# Altium schematic sheet DIOT_connectors_P1_P2_P3.SchDoc: =DocumentName
size A3; EDA_Number: EDA-04514-V3-0; Projet: DI/OT System Board; ModifiedBy: -; CheckedDate: -; Title2: DIOT connectors P1 P2 P3; DivGrp: WUT ISE; Designer: F.Świtakowski; DocumentNumber: 2; Revision: 0; SheetNumber: 2; SheetTotal: 17
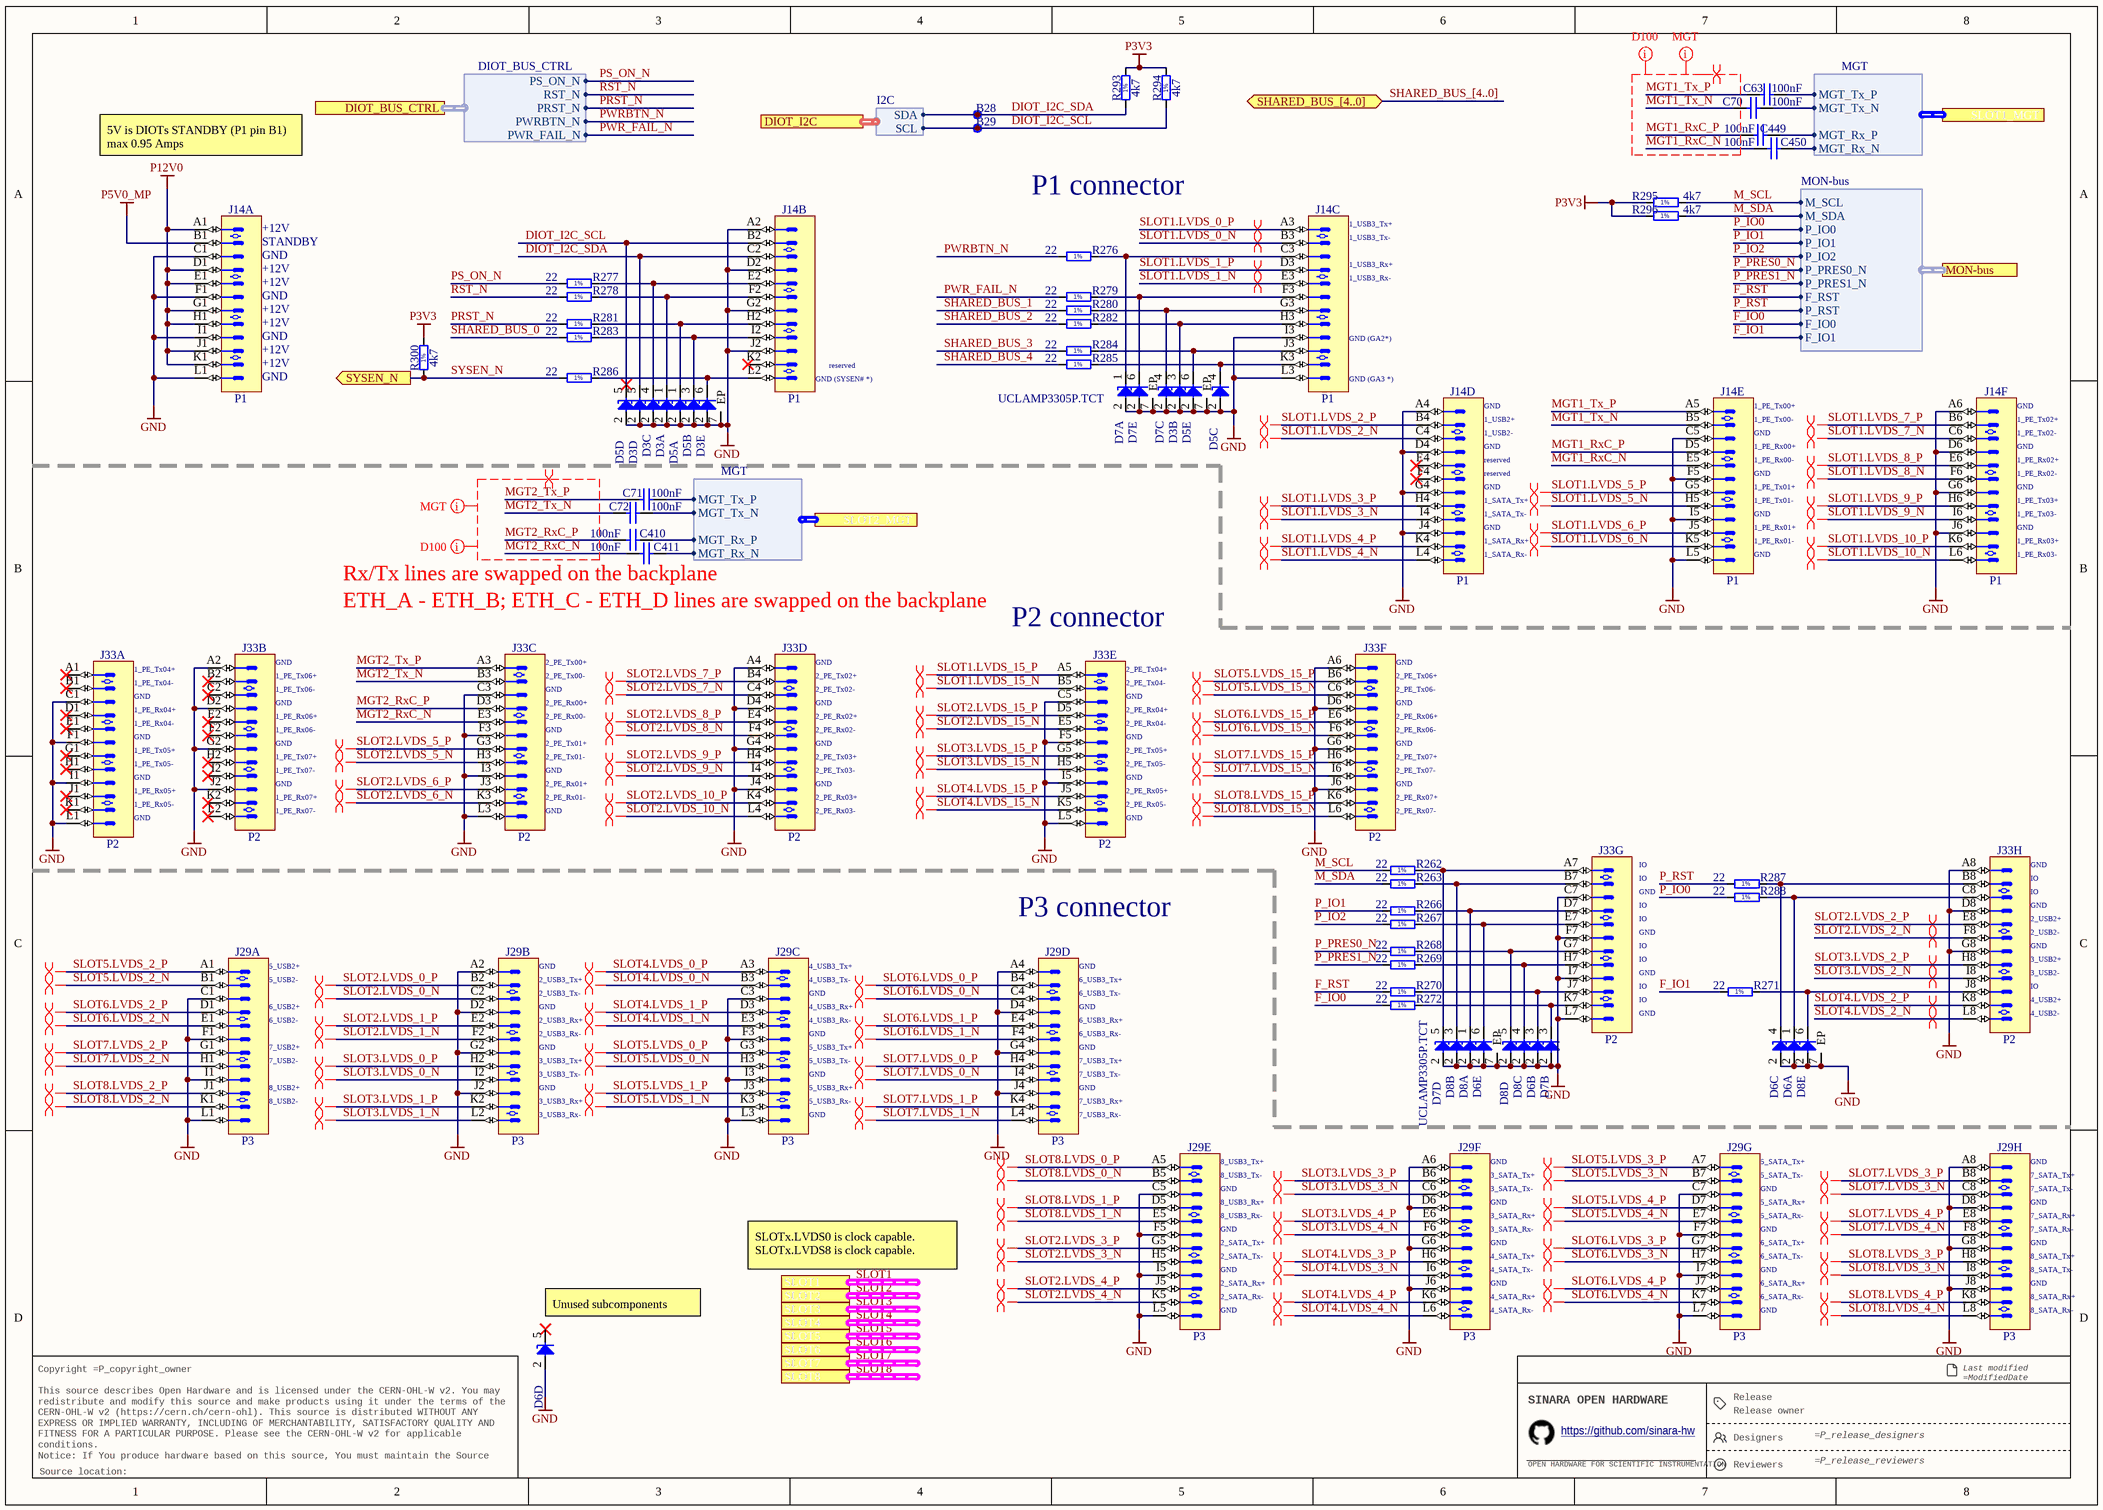
[diagram p0: DIOT_connectors_P1_P2_P3.SchDoc]

## Parts
B28  SMD Pad  [C100]  (value not drawn)  (no BOM)
B29  SMD Pad  [C100]  (value not drawn)  (no BOM)
C63  100nF  [CAPC0603X33N]
C70  100nF  [CAPC0603X33N]
C71  100nF  [CAPC0603X33N]
C72  100nF  [CAPC0603X33N]
C410  100nF  [CAPC0603X33N]
C411  100nF  [CAPC0603X33N]
C449  100nF  [CAPC0603X33N]
C450  100nF  [CAPC0603X33N]
D3  UCLAMP3305P.TCT  [SON50P160X65_HS-7N]  (value not drawn)  (parts A,B,C,D,E of 5)
D5  UCLAMP3305P.TCT  [SON50P160X65_HS-7N]  (value not drawn)  (parts A,B,C,D,E of 5)
D6  UCLAMP3305P.TCT  [SON50P160X65_HS-7N]  (value not drawn)  (parts A,B,C,D,E of 5)
D7  UCLAMP3305P.TCT  [SON50P160X65_HS-7N]  (value not drawn)  (parts A,B,C,D,E of 5)
D8  UCLAMP3305P.TCT  [SON50P160X65_HS-7N]  (value not drawn)  (parts A,B,C,D,E of 5)
J14  P1  [AMPHENOL_10052825-101LF]  (parts A,B,C,D,E,F of 6)
J29  P3  [AMPHENOL_10052837-101LF]  (parts A,B,C,D,E,F,G,H of 8)
J33  P2  [AMPHENOL_10052837-101LF]  (parts A,B,C,D,E,F,G,H of 8)
R262  22  [RESC1005X40N]
R263  22  [RESC1005X40N]
R266  22  [RESC1005X40N]
R267  22  [RESC1005X40N]
R268  22  [RESC1005X40N]
R269  22  [RESC1005X40N]
R270  22  [RESC1005X40N]
R271  22  [RESC1005X40N]
R272  22  [RESC1005X40N]
R276  22  [RESC1005X40N]
R277  22  [RESC1005X40N]
R278  22  [RESC1005X40N]
R279  22  [RESC1005X40N]
R280  22  [RESC1005X40N]
R281  22  [RESC1005X40N]
R282  22  [RESC1005X40N]
R283  22  [RESC1005X40N]
R284  22  [RESC1005X40N]
R285  22  [RESC1005X40N]
R286  22  [RESC1005X40N]
R287  22  [RESC1005X40N]
R288  22  [RESC1005X40N]
R293  4k7  [RESC1005X40N]
R294  4k7  [RESC1005X40N]
R295  4k7  [RESC1005X40N]
R296  4k7  [RESC1005X40N]
R300  4k7  [RESC1005X40N]

## Ports
DIOT_BUS_CTRL (harness DIOT_BUS_CTRL), DIOT_I2C (harness I2C), MON-bus (harness MON-bus), SHARED_BUS_[4..0] (bidir), SLOT1 (harness SLOT), SLOT1_MGT (harness MGT), SLOT2 (harness SLOT), SLOT2_MGT (harness MGT), SLOT3 (harness SLOT), SLOT4 (harness SLOT), SLOT5 (harness SLOT), SLOT6 (harness SLOT), SLOT7 (harness SLOT), SLOT8 (harness SLOT), SYSEN_N (out)

## Harnesses
MGT: MGT_Tx_P, MGT_Tx_N, MGT_Rx_P, MGT_Rx_N
DIOT_BUS_CTRL: PS_ON_N, RST_N, PRST_N, PWRBTN_N, PWR_FAIL_N
MON-bus: M_SCL, M_SDA, P_IO0, P_IO1, P_IO2, P_PRES0_N, P_PRES1_N, F_RST, P_RST, F_IO0, F_IO1
I2C: SDA, SCL

## Nets
GND: D3.2(A) D3.7(EP) D5.2(A) D5.7(EP) D6.2(A) D6.7(EP) D7.2(A) D7.7(EP) D8.2(A) D8.7(EP) J14.A2 J14.A4 J14.A6 J14.C1 J14.C5 J14.D2 J14.D4 J14.D6 J14.F1 J14.F5 J14.G2 J14.G4 J14.G6 J14.I1 J14.I3 J14.I5 J14.J2 J14.J4 J14.J6 J14.L1 J14.L3 J14.L5 J29.A2 J29.A4 J29.A6 J29.A8 J29.C1 J29.C3 J29.C5 J29.C7 J29.D2 J29.D4 J29.D6 J29.D8 J29.F1 J29.F3 J29.F5 J29.F7 J29.G2 J29.G4 J29.G6 J29.G8 J29.I1 J29.I3 J29.I5 J29.I7 J29.J2 J29.J4 J29.J6 J29.J8 J29.L1 J29.L3 J29.L5 J29.L7 J33.A2 J33.A4 J33.A6 J33.A8 J33.C1 J33.C3 J33.C5 J33.C7 J33.D2 J33.D4 J33.D6 J33.D8 J33.F1 J33.F3 J33.F5 J33.F7 J33.G2 J33.G4 J33.G6 J33.G8 J33.I1 J33.I3 J33.I5 J33.I7 J33.J2 J33.J4 J33.J6 J33.L1 J33.L3 J33.L5 J33.L7
P3V3: R293.2 R294.2 R295.2 R296.2 R300.2
P5V0_MP: J14.B1
P12V0: J14.A1 J14.D1 J14.E1 J14.G1 J14.H1 J14.J1 J14.K1
DIOT_I2C_SCL: B29.1 D5.5(C) J14.B2 R294.1 ; port DIOT_I2C.SCL
DIOT_I2C_SDA: B28.1 D3.5(C) J14.C2 R293.1 ; port DIOT_I2C.SDA
F_IO0: R272.1 ; port MON-bus.F_IO0
F_IO1: R271.1 ; port MON-bus.F_IO1
F_RST: R270.1 ; port MON-bus.F_RST
M_SCL: R262.1 R295.1 ; port MON-bus.M_SCL
M_SDA: R263.1 R296.1 ; port MON-bus.M_SDA
MGT1_RxC_N: C450.1 J14.E5
MGT1_RxC_P: C449.1 J14.D5
MGT1_Tx_N: C70.2 J14.B5
MGT1_Tx_P: C63.2 J14.A5
MGT2_RxC_N: C411.1 J33.E3
MGT2_RxC_P: C410.1 J33.D3
MGT2_Tx_N: C72.2 J33.B3
MGT2_Tx_P: C71.2 J33.A3
P_IO0: R288.1 ; port MON-bus.P_IO0
P_IO1: R266.1 ; port MON-bus.P_IO1
P_IO2: R267.1 ; port MON-bus.P_IO2
P_PRES0_N: R268.1 ; port MON-bus.P_PRES0_N
P_PRES1_N: R269.1 ; port MON-bus.P_PRES1_N
P_RST: R287.1 ; port MON-bus.P_RST
PRST_N: R281.1 ; port DIOT_BUS_CTRL.PRST_N
PS_ON_N: R277.1 ; port DIOT_BUS_CTRL.PS_ON_N
PWR_FAIL_N: R279.1 ; port DIOT_BUS_CTRL.PWR_FAIL_N
PWRBTN_N: R276.1 ; port DIOT_BUS_CTRL.PWRBTN_N
RST_N: R278.1 ; port DIOT_BUS_CTRL.RST_N
SHARED_BUS_0: R283.1
SHARED_BUS_1: R280.1
SHARED_BUS_2: R282.1
SHARED_BUS_3: R284.1
SHARED_BUS_4: R285.1
SLOT1.LVDS_0_N: J14.B3
SLOT1.LVDS_0_P: J14.A3
SLOT1.LVDS_1_N: J14.E3
SLOT1.LVDS_1_P: J14.D3
SLOT1.LVDS_2_N: J14.C4
SLOT1.LVDS_2_P: J14.B4
SLOT1.LVDS_3_N: J14.I4
SLOT1.LVDS_3_P: J14.H4
SLOT1.LVDS_4_N: J14.L4
SLOT1.LVDS_4_P: J14.K4
SLOT1.LVDS_5_N: J14.H5
SLOT1.LVDS_5_P: J14.G5
SLOT1.LVDS_6_N: J14.K5
SLOT1.LVDS_6_P: J14.J5
SLOT1.LVDS_7_N: J14.C6
SLOT1.LVDS_7_P: J14.B6
SLOT1.LVDS_8_N: J14.F6
SLOT1.LVDS_8_P: J14.E6
SLOT1.LVDS_9_N: J14.I6
SLOT1.LVDS_9_P: J14.H6
SLOT1.LVDS_10_N: J14.L6
SLOT1.LVDS_10_P: J14.K6
SLOT1.LVDS_15_N: J33.B5
SLOT1.LVDS_15_P: J33.A5
SLOT2.LVDS_0_N: J29.C2
SLOT2.LVDS_0_P: J29.B2
SLOT2.LVDS_1_N: J29.F2
SLOT2.LVDS_1_P: J29.E2
SLOT2.LVDS_2_N: J33.F8
SLOT2.LVDS_2_P: J33.E8
SLOT2.LVDS_3_N: J29.H5
SLOT2.LVDS_3_P: J29.G5
SLOT2.LVDS_4_N: J29.K5
SLOT2.LVDS_4_P: J29.J5
SLOT2.LVDS_5_N: J33.H3
SLOT2.LVDS_5_P: J33.G3
SLOT2.LVDS_6_N: J33.K3
SLOT2.LVDS_6_P: J33.J3
SLOT2.LVDS_7_N: J33.C4
SLOT2.LVDS_7_P: J33.B4
SLOT2.LVDS_8_N: J33.F4
SLOT2.LVDS_8_P: J33.E4
SLOT2.LVDS_9_N: J33.I4
SLOT2.LVDS_9_P: J33.H4
SLOT2.LVDS_10_N: J33.L4
SLOT2.LVDS_10_P: J33.K4
SLOT2.LVDS_15_N: J33.E5
SLOT2.LVDS_15_P: J33.D5
SLOT3.LVDS_0_N: J29.I2
SLOT3.LVDS_0_P: J29.H2
SLOT3.LVDS_1_N: J29.L2
SLOT3.LVDS_1_P: J29.K2
SLOT3.LVDS_2_N: J33.I8
SLOT3.LVDS_2_P: J33.H8
SLOT3.LVDS_3_N: J29.C6
SLOT3.LVDS_3_P: J29.B6
SLOT3.LVDS_4_N: J29.F6
SLOT3.LVDS_4_P: J29.E6
SLOT3.LVDS_15_N: J33.H5
SLOT3.LVDS_15_P: J33.G5
SLOT4.LVDS_0_N: J29.B3
SLOT4.LVDS_0_P: J29.A3
SLOT4.LVDS_1_N: J29.E3
SLOT4.LVDS_1_P: J29.D3
SLOT4.LVDS_2_N: J33.L8
SLOT4.LVDS_2_P: J33.K8
SLOT4.LVDS_3_N: J29.I6
SLOT4.LVDS_3_P: J29.H6
SLOT4.LVDS_4_N: J29.L6
SLOT4.LVDS_4_P: J29.K6
SLOT4.LVDS_15_N: J33.K5
SLOT4.LVDS_15_P: J33.J5
SLOT5.LVDS_0_N: J29.H3
SLOT5.LVDS_0_P: J29.G3
SLOT5.LVDS_1_N: J29.K3
SLOT5.LVDS_1_P: J29.J3
SLOT5.LVDS_2_N: J29.B1
SLOT5.LVDS_2_P: J29.A1
SLOT5.LVDS_3_N: J29.B7
SLOT5.LVDS_3_P: J29.A7
SLOT5.LVDS_4_N: J29.E7
SLOT5.LVDS_4_P: J29.D7
SLOT5.LVDS_15_N: J33.C6
SLOT5.LVDS_15_P: J33.B6
SLOT6.LVDS_0_N: J29.C4
SLOT6.LVDS_0_P: J29.B4
SLOT6.LVDS_1_N: J29.F4
SLOT6.LVDS_1_P: J29.E4
SLOT6.LVDS_2_N: J29.E1
SLOT6.LVDS_2_P: J29.D1
SLOT6.LVDS_3_N: J29.H7
SLOT6.LVDS_3_P: J29.G7
SLOT6.LVDS_4_N: J29.K7
SLOT6.LVDS_4_P: J29.J7
SLOT6.LVDS_15_N: J33.F6
SLOT6.LVDS_15_P: J33.E6
SLOT7.LVDS_0_N: J29.I4
SLOT7.LVDS_0_P: J29.H4
SLOT7.LVDS_1_N: J29.L4
SLOT7.LVDS_1_P: J29.K4
SLOT7.LVDS_2_N: J29.H1
SLOT7.LVDS_2_P: J29.G1
SLOT7.LVDS_3_N: J29.C8
SLOT7.LVDS_3_P: J29.B8
SLOT7.LVDS_4_N: J29.F8
SLOT7.LVDS_4_P: J29.E8
SLOT7.LVDS_15_N: J33.I6
SLOT7.LVDS_15_P: J33.H6
SLOT8.LVDS_0_N: J29.B5
SLOT8.LVDS_0_P: J29.A5
SLOT8.LVDS_1_N: J29.E5
SLOT8.LVDS_1_P: J29.D5
SLOT8.LVDS_2_N: J29.K1
SLOT8.LVDS_2_P: J29.J1
SLOT8.LVDS_3_N: J29.I8
SLOT8.LVDS_3_P: J29.H8
SLOT8.LVDS_4_N: J29.L8
SLOT8.LVDS_4_P: J29.K8
SLOT8.LVDS_15_N: J33.L6
SLOT8.LVDS_15_P: J33.K6
SYSEN_N: R286.1 R300.1 ; port SYSEN_N
NetC63_1: C63.1 ; port SLOT1_MGT.MGT_Tx_P
NetC70_1: C70.1 ; port SLOT1_MGT.MGT_Tx_N
NetC71_1: C71.1 ; port SLOT2_MGT.MGT_Tx_P
NetC72_1: C72.1 ; port SLOT2_MGT.MGT_Tx_N
NetC410_2: C410.2 ; port SLOT2_MGT.MGT_Rx_P
NetC411_2: C411.2 ; port SLOT2_MGT.MGT_Rx_N
NetC449_2: C449.2 ; port SLOT1_MGT.MGT_Rx_P
NetC450_2: C450.2 ; port SLOT1_MGT.MGT_Rx_N
NetD3_1: D3.1(C) J14.F2 R278.2
NetD3_3: D3.3(C) J14.H3 R282.2
NetD3_4: D3.4(C) J14.E2 R277.2
NetD3_6: D3.6(C) J14.L2 R286.2
NetD5_1: D5.1(C) J14.H2 R281.2
NetD5_3: D5.3(C) J14.I2 R283.2
NetD5_4: D5.4(C) J14.K3 R285.2
NetD5_6: D5.6(C) J14.J3 R284.2
NetD6_1: D6.1(C) J33.C8 R288.2
NetD6_3: D6.3(C) J33.J7 R270.2
NetD6_4: D6.4(C) J33.B8 R287.2
NetD6_6: D6.6(C) J33.E7 R267.2
NetD7_1: D7.1(C) J14.C3 R276.2
NetD7_3: D7.3(C) J33.K7 R272.2
NetD7_4: D7.4(C) J14.G3 R280.2
NetD7_5: D7.5(C) J33.A7 R262.2
NetD7_6: D7.6(C) J14.F3 R279.2
NetD8_1: D8.1(C) J33.D7 R266.2
NetD8_3: D8.3(C) J33.B7 R263.2
NetD8_4: D8.4(C) J33.H7 R269.2
NetD8_5: D8.5(C) J33.G7 R268.2
NetD8_6: D8.6(C) J33.J8 R271.2

Not connected (* = marked no-connect by the designer): D6 5(C)*; J14 E4* F4* K2*; J33 A1* B1* B2* C2* D1* E1* E2* F2* G1* H1* H2* I2* J1* K1* K2* L2*

## Buses and harness runs
bus SHARED_BUS_[4..0] = port SHARED_BUS_[4..0]
harness SLOT1 = port SLOT1
harness SLOT2 = port SLOT2
harness SLOT3 = port SLOT3
harness SLOT4 = port SLOT4
harness SLOT5 = port SLOT5
harness SLOT6 = port SLOT6
harness SLOT7 = port SLOT7
harness SLOT8 = port SLOT8

## Layout directives
differential pair: MGT1_RxC_N, MGT1_RxC_P, MGT1_Tx_N, MGT1_Tx_P, MGT2_RxC_N, MGT2_RxC_P, MGT2_Tx_N, MGT2_Tx_P, SLOT1.LVDS_0_N, SLOT1.LVDS_0_P, SLOT1.LVDS_1_N, SLOT1.LVDS_1_P, SLOT1.LVDS_2_N, SLOT1.LVDS_2_P, SLOT1.LVDS_3_N, SLOT1.LVDS_3_P, SLOT1.LVDS_4_N, SLOT1.LVDS_4_P, SLOT1.LVDS_5_N, SLOT1.LVDS_5_P, SLOT1.LVDS_6_N, SLOT1.LVDS_6_P, SLOT1.LVDS_7_N, SLOT1.LVDS_7_P, SLOT1.LVDS_8_N, SLOT1.LVDS_8_P, SLOT1.LVDS_9_N, SLOT1.LVDS_9_P, SLOT1.LVDS_10_N, SLOT1.LVDS_10_P, SLOT1.LVDS_15_N, SLOT1.LVDS_15_P, SLOT2.LVDS_0_N, SLOT2.LVDS_0_P, SLOT2.LVDS_1_N, SLOT2.LVDS_1_P, SLOT2.LVDS_2_N, SLOT2.LVDS_2_P, SLOT2.LVDS_3_N, SLOT2.LVDS_3_P, SLOT2.LVDS_4_N, SLOT2.LVDS_4_P, SLOT2.LVDS_5_N, SLOT2.LVDS_5_P, SLOT2.LVDS_6_N, SLOT2.LVDS_6_P, SLOT2.LVDS_7_N, SLOT2.LVDS_7_P, SLOT2.LVDS_8_N, SLOT2.LVDS_8_P, SLOT2.LVDS_9_N, SLOT2.LVDS_9_P, SLOT2.LVDS_10_N, SLOT2.LVDS_10_P, SLOT2.LVDS_15_N, SLOT2.LVDS_15_P, SLOT3.LVDS_0_N, SLOT3.LVDS_0_P, SLOT3.LVDS_1_N, SLOT3.LVDS_1_P, SLOT3.LVDS_2_N, SLOT3.LVDS_2_P, SLOT3.LVDS_3_N, SLOT3.LVDS_3_P, SLOT3.LVDS_4_N, SLOT3.LVDS_4_P, SLOT3.LVDS_15_N, SLOT3.LVDS_15_P, SLOT4.LVDS_0_N, SLOT4.LVDS_0_P, SLOT4.LVDS_1_N, SLOT4.LVDS_1_P, SLOT4.LVDS_2_N, SLOT4.LVDS_2_P, SLOT4.LVDS_3_N, SLOT4.LVDS_3_P, SLOT4.LVDS_4_N, SLOT4.LVDS_4_P, SLOT4.LVDS_15_N, SLOT4.LVDS_15_P, SLOT5.LVDS_0_N, SLOT5.LVDS_0_P, SLOT5.LVDS_1_N, SLOT5.LVDS_1_P, SLOT5.LVDS_2_N, SLOT5.LVDS_2_P, SLOT5.LVDS_3_N, SLOT5.LVDS_3_P, SLOT5.LVDS_4_N, SLOT5.LVDS_4_P, SLOT5.LVDS_15_N, SLOT5.LVDS_15_P, SLOT6.LVDS_0_N, SLOT6.LVDS_0_P, SLOT6.LVDS_1_N, SLOT6.LVDS_1_P, SLOT6.LVDS_2_N, SLOT6.LVDS_2_P, SLOT6.LVDS_3_N, SLOT6.LVDS_3_P, SLOT6.LVDS_4_N, SLOT6.LVDS_4_P, SLOT6.LVDS_15_N, SLOT6.LVDS_15_P, SLOT7.LVDS_0_N, SLOT7.LVDS_0_P, SLOT7.LVDS_1_N, SLOT7.LVDS_1_P, SLOT7.LVDS_2_N, SLOT7.LVDS_2_P, SLOT7.LVDS_3_N, SLOT7.LVDS_3_P, SLOT7.LVDS_4_N, SLOT7.LVDS_4_P, SLOT7.LVDS_15_N, SLOT7.LVDS_15_P, SLOT8.LVDS_0_N, SLOT8.LVDS_0_P, SLOT8.LVDS_1_N, SLOT8.LVDS_1_P, SLOT8.LVDS_2_N, SLOT8.LVDS_2_P, SLOT8.LVDS_3_N, SLOT8.LVDS_3_P, SLOT8.LVDS_4_N, SLOT8.LVDS_4_P, SLOT8.LVDS_15_N, SLOT8.LVDS_15_P
net class MGT: MGT1_RxC_N, MGT1_RxC_P, MGT1_Tx_N, MGT1_Tx_P, MGT2_RxC_N, MGT2_RxC_P, MGT2_Tx_N, MGT2_Tx_P
net class D100: MGT1_RxC_N, MGT1_RxC_P, MGT1_Tx_N, MGT1_Tx_P, MGT2_RxC_N, MGT2_RxC_P, MGT2_Tx_N, MGT2_Tx_P

## Notes on the sheet
- 5V is DIOTs STANDBY (P1 pin B1)
  max 0.95 Amps
- (near J14) +12V
- (near J14) STANDBY
- P1 connector
- (near J14) 1_USB3_Tx+
- (near J14) 1_USB3_Tx-
- (near J14) GND
- (near J14) 1_USB3_Rx+
- (near J14) 1_USB3_Rx-
- (near J14) GND (SYSEN# *)
- reserved
- (near J14) GND (GA2*)
- (near J14) GND (GA3 *)
- (near J14) 1_USB2+
- (near J14) 1_USB2-
- (near J14) 1_PE_Tx00+
- (near J14) 1_PE_Tx00-
- (near J14) 1_PE_Rx00+
- (near J14) 1_PE_Tx02+
- (near J14) 1_PE_Tx02-
- (near J14) 1_SATA_Tx+
- (near J14) 1_SATA_Tx-
- (near J14) reserved
- (near J14) 1_PE_Tx01+
- (near J14) 1_PE_Tx01-
- (near J14) 1_PE_Rx00-
- (near J14) 1_PE_Rx02+
- (near J14) 1_PE_Rx02-
- (near J14) 1_PE_Tx03+
- (near J14) 1_PE_Tx03-
- (near C411) Rx/Tx lines are swapped on the backplane
- (near J14) 1_SATA_Rx+
- (near J14) 1_SATA_Rx-
- (near J14) 1_PE_Rx01+
- (near J14) 1_PE_Rx01-
- (near J14) 1_PE_Rx03+
- (near J14) 1_PE_Rx03-
- ETH_A - ETH_B; ETH_C - ETH_D lines are swapped on the backplane
- (near J33) P2 connector
- (near J33) 1_PE_Tx04+
- (near J33) 1_PE_Tx04-
- (near J33) GND
- (near J33) 1_PE_Rx04+
- (near J33) 1_PE_Rx04-
- (near J33) 1_PE_Tx06+
- (near J33) 1_PE_Tx06-
- (near J33) 1_PE_Rx06+
- (near J33) 2_PE_Tx00+
- (near J33) 2_PE_Tx00-
- (near J33) 2_PE_Rx00+
- (near J33) 2_PE_Rx00-
- (near J33) 2_PE_Tx02+
- (near J33) 2_PE_Tx02-
- (near J33) 2_PE_Rx02+
- (near J33) 2_PE_Tx04+
- (near J33) 2_PE_Tx04-
- (near J33) 2_PE_Rx04+
- (near J33) 2_PE_Rx04-
- (near J33) 2_PE_Tx06+
- (near J33) 2_PE_Tx06-
- (near J33) 2_PE_Rx06+
- (near J33) 1_PE_Tx05+
- (near J33) 1_PE_Tx05-
- (near J33) 1_PE_Rx06-
- (near J33) 1_PE_Tx07+
- (near J33) 1_PE_Tx07-
- (near J33) 2_PE_Tx01+
- (near J33) 2_PE_Tx01-
- (near J33) 2_PE_Rx01+
- (near J33) 2_PE_Rx02-
- (near J33) 2_PE_Tx03+
- (near J33) 2_PE_Tx03-
- (near J33) 2_PE_Tx05+
- (near J33) 2_PE_Tx05-
- (near J33) 2_PE_Rx06-
- (near J33) 2_PE_Tx07+
- (near J33) 2_PE_Tx07-
- (near J33) 1_PE_Rx05+
- (near J33) 1_PE_Rx05-
- (near J33) 1_PE_Rx07+
- (near J33) 1_PE_Rx07-
- (near J33) 2_PE_Rx01-
- (near J33) 2_PE_Rx03+
- (near J33) 2_PE_Rx03-
- (near J33) 2_PE_Rx05+
- (near J33) 2_PE_Rx05-
- (near J33) 2_PE_Rx07+
- 2_PE_Rx07-
- P3 connector
- (near J33) IO
- (near J33) 2_USB2+
- (near J29) 5_USB2+
- (near J29) 5_USB2-
- (near J29) GND
- (near J29) 2_USB3_Tx+
- (near J29) 2_USB3_Tx-
- (near J29) 4_USB3_Tx+
- (near J29) 4_USB3_Tx-
- (near J29) 6_USB3_Tx+
- (near J29) 6_USB3_Tx-
- (near J33) 2_USB2-
- (near J33) 3_USB2+
- (near J33) 3_USB2-
- (near J29) 6_USB2+
- (near J29) 6_USB2-
- (near J29) 7_USB2+
- (near J29) 2_USB3_Rx+
- (near J29) 2_USB3_Rx-
- (near J29) 4_USB3_Rx+
- (near J29) 4_USB3_Rx-
- (near J29) 5_USB3_Tx+
- (near J29) 6_USB3_Rx+
- (near J29) 6_USB3_Rx-
- (near J33) 4_USB2+
- (near J33) 4_USB2-
- (near J29) 7_USB2-
- (near J29) 8_USB2+
- (near J29) 8_USB2-
- (near J29) 3_USB3_Tx+
- (near J29) 3_USB3_Tx-
- (near J29) 3_USB3_Rx+
- (near J29) 3_USB3_Rx-
- (near J29) 5_USB3_Tx-
- (near J29) 5_USB3_Rx+
- (near J29) 5_USB3_Rx-
- (near J29) 7_USB3_Tx+
- (near J29) 7_USB3_Tx-
- (near J29) 7_USB3_Rx+
- (near J29) 7_USB3_Rx-
- (near J29) 8_USB3_Tx+
- (near J29) 8_USB3_Tx-
- (near J29) 3_SATA_Tx+
- (near J29) 3_SATA_Tx-
- (near J29) 5_SATA_Tx+
- (near J29) 5_SATA_Tx-
- (near J29) 7_SATA_Tx+
- (near J29) 7_SATA_Tx-
- SLOTx.LVDS0 is clock capable.
  SLOTx.LVDS8 is clock capable.
- (near J29) 8_USB3_Rx+
- (near J29) 8_USB3_Rx-
- (near J29) 2_SATA_Tx+
- (near J29) 2_SATA_Tx-
- (near J29) 3_SATA_Rx+
- (near J29) 3_SATA_Rx-
- (near J29) 4_SATA_Tx+
- (near J29) 5_SATA_Rx+
- (near J29) 5_SATA_Rx-
- (near J29) 6_SATA_Tx+
- (near J29) 6_SATA_Tx-
- (near J29) 7_SATA_Rx+
- (near J29) 7_SATA_Rx-
- (near J29) 8_SATA_Tx+
- (near D6) Unused subcomponents
- (near J29) 2_SATA_Rx+
- (near J29) 2_SATA_Rx-
- (near J29) 4_SATA_Tx-
- (near J29) 4_SATA_Rx+
- (near J29) 4_SATA_Rx-
- (near J29) 6_SATA_Rx+
- (near J29) 6_SATA_Rx-
- (near J29) 8_SATA_Tx-
- (near J29) 8_SATA_Rx+
- (near J29) 8_SATA_Rx-
- Release
- Last modified =ModifiedDate
  Sheet =sheetnumber of =sheettotal · Size A3
- Copyright =P_copyright_owner
  This source describes Open Hardware and is licensed under the CERN-OHL-W v2. You may redistribute and modify this source and make products using it under the terms of the CERN-OHL-W v2 (https://cern.ch/cern-ohl). This source is distributed WITHOUT ANY EXPRESS OR IMPLIED WARRANTY, INCLUDING OF MERCHANTABILITY, SATISFACTORY QUALITY AND FITNESS FOR A PARTICULAR PURPOSE. Please see the CERN-OHL-W v2 for applicable conditions.
  Notice: If You produce hardware based on this source, You must maintain the Source Location visible on the product, its packaging or its documentation.
- SINARA OPEN HARDWARE
- OPEN HARDWARE FOR SCIENTIFIC INSTRUMENTATION
- https://github.com/sinara-hw
- Release owner
- Designers
- Reviewers
- Source location:
- (in symbol R0402_4K7_1%_0.0625W_100PPM) 1%
- (in symbol R0402_22R_1%_0.0625W_100PPM) 1%

## Library data of the parts
B28 B29 = SMD_PAD_D1MM: Through Hole Pad; Part Description: 1mm Diameter SMD Pad; Mounted: No; Part Number: SMD_PAD_D1MM; Component Type: Standard (No BOM); Pin Count: 1; Family: SMD Pad; Socket: No; SMD: No; Sense: No; Status: None; ComponentHeight: 0mm; HelpURL: Undefined; Author: CERN DEM JLC; CreateDate: 10.10.2017; LatestRevisionDate: 10.10.2017; PackageDescription: 1mm Diameter SMD Pad
C63 C70-C72 C410 C411 C449 C450 = CC0201_100NF_6.3V_10%_X5R: Non-polarised capacitor; Part Description: SMD Multilayer Chip Ceramic Capacitor; Manufacturer: GENERIC; Manufacturer1 Part Number: 02016D104KAT2A; Voltage: 6.3V; TC: X5R; Tolerance: ±10%; Part Number: CC0201_100NF_6.3V_10%_X5R; Component Kind: Standard; Component Type: Standard; Pin Count: 2; Value: 100nF; Status: Not Recommended; Manufacturer Part Number: CC0201_100NF_6.3V_10%_X5R; Case: 0201; Mounted: Yes; Socket: No; SMD: Yes; Sense: No; Manufacturer1 Example: AVX; Manufacturer1 ComponentHeight: 0.33mm; HelpURL: \\cern.ch\dfs\Applications\Altium\Datasheets\CC0201_X5R_AVX.pdf; Author: CERN DEM JLC; CreateDate: 03.12.2007; LatestRevisionDate: 03.12.2007
D3 D5-D8 = CMP-004-00037-2: Diode TVS Quint Common Anode Uni-Dir 3.3V 40W 6-Pin SLP EP T/R; Max Operating Temperature: 125°C; Min Operating Temperature: -55°C; Pins: 6; Mounting Technology: Surface Mount
J14 = AMPHENOL_10052825-101LF: 72 Contacts Header, 6 Columns, 4 Pairs per Column; Part Description: 72 Contacts, 2mm Pitch, 6 Columns, 4 Pairs per Column, 4 Walls, Right Angle Header; Part Number: AMPHENOL_10052825-101LF; Component Kind: Standard; Component Type: Standard; Pin Count: 72; Family: AirMax VS; Mounted: Yes; Socket: No; SMD: No; PressFit: Yes; Sense: No; Status: None; Manufacturer: AMPHENOL; Manufacturer Part Number: 10052825-101LF; ComponentHeight: 15.35mm; HelpURL: \\cern.ch\dfs\Applications\Altium\Datasheets\AMPHENOL_10052825-101LF.pdf; ComponentLink1URL: \\cern.ch\dfs\Applications\Altium\Datasheets\AMPHENOL_10052825-101LF_Application.pdf; ComponentLink1Description: Application; Author: CERN DEM MR; CreateDate: 19/02/2018; LatestRevisionDate: 19/02/2018; Classname: Overlapping
J29 J33 = AMPHENOL_10052837-101LF: 96 Contacts Header, 8 Columns, 4 Pairs per Column; Part Description: 96 Contacts, 2mm Pitch, 8 Columns, 4 Pairs per Column, 2 Walls, Right Angle Header; Part Number: AMPHENOL_10052837-101LF; Component Kind: Standard; Component Type: Standard; Pin Count: 96; Family: AirMax VS; Mounted: Yes; Socket: No; SMD: No; PressFit: Yes; Sense: No; Status: None; Manufacturer: AMPHENOL; Manufacturer Part Number: 10052837-101LF; ComponentHeight: 15.35mm; HelpURL: \\cern.ch\dfs\Applications\Altium\Datasheets\AMPHENOL_10052837-101LF.pdf; ComponentLink1URL: \\cern.ch\dfs\Applications\Altium\Datasheets\AMPHENOL_10052837-101LF_Application.pdf; ComponentLink1Description: Application; Author: CERN DEM MR; CreateDate: 19/02/2018; LatestRevisionDate: 19/02/2018
R262 R263 R266-R272 R276-R288 = R0402_22R_1%_0.0625W_100PPM: Resistor - 1%; Part Description: General Purpose Thick Film Chip Resistor; Manufacturer: GENERIC; Manufacturer1 Part Number: 232270672209L; TC: ±100ppm/°C; PressFit: No; Part Number: R0402_22R_1%_0.0625W_100PPM; Component Kind: Standard; Component Type: Standard; Pin Count: 2; Value: 22; Status: Not Recommended; Power: 0.0625W; Tolerance: ±1%; Manufacturer Part Number: R0402_22R_1%_0.0625W_100PPM; Case: 0402; Mounted: Yes; Socket: No; SMD: Yes; Manufacturer1 Example: YAGEO PHYCOMP; Manufacturer1 ComponentHeight: 0.4mm; HelpURL: \\cern.ch\dfs\Applications\Altium\Datasheets\R0402_Phycomp_RC0402.pdf; Author: CERN DEM JLC; CreateDate: 03.12.2007; LatestRevisionDate: 17.10.2012; Sense: No
R293-R296 R300 = R0402_4K7_1%_0.0625W_100PPM: Resistor - 1%; Part Description: General Purpose Thick Film Chip Resistor; Manufacturer: GENERIC; Manufacturer1 Part Number: 232270674702L; TC: ±100ppm/°C; PressFit: No; Part Number: R0402_4K7_1%_0.0625W_100PPM; Component Kind: Standard; Component Type: Standard; Pin Count: 2; Value: 4k7; Status: Not Recommended; Power: 0.0625W; Tolerance: ±1%; Manufacturer Part Number: R0402_4K7_1%_0.0625W_100PPM; Case: 0402; Mounted: Yes; Sense: No; Socket: No; SMD: Yes; Manufacturer1 Example: YAGEO PHYCOMP; Manufacturer1 ComponentHeight: 0.4mm; HelpURL: \\cern.ch\dfs\Applications\Altium\Datasheets\R0402_Phycomp_RC0402.pdf; Author: CERN DEM JLC
  R293-R296: CreateDate: 03.12.2007; LatestRevisionDate: 17.10.2012
  R300: CreateDate: 03-Dec-07; LatestRevisionDate: 17-Oct-12